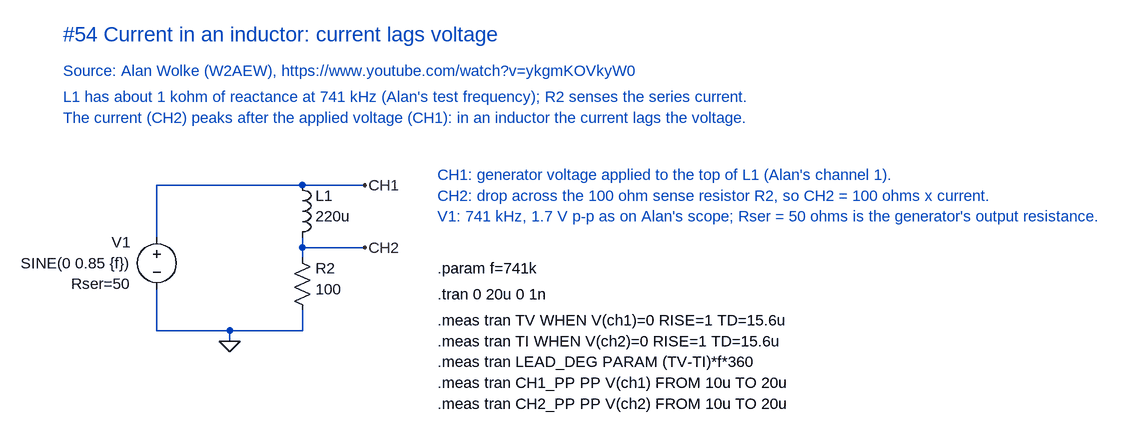
[diagram p0: schematic Current in an Inductor.asc]
Current in an Inductor.asc, the LTspice schematic file:
Version 4.1
SHEET 1 1400 700
WIRE 48 32 272 32
WIRE 272 32 368 32
WIRE 48 32 48 112
WIRE 272 112 272 144
WIRE 272 128 368 128
WIRE 272 224 272 256
WIRE 48 192 48 256
WIRE 48 256 160 256
WIRE 160 256 272 256
WIRE 160 256 160 272
FLAG 160 272 0
FLAG 368 32 CH1
FLAG 368 128 CH2
SYMBOL voltage 48 96 R0
WINDOW 0 -40 24 Right 2
WINDOW 3 -40 56 Right 2
WINDOW 123 0 0 Left 0
WINDOW 39 -40 88 Right 2
SYMATTR InstName V1
SYMATTR Value SINE(0 0.85 {f})
SYMATTR SpiceLine Rser=50
SYMBOL ind 256 16 R0
WINDOW 0 36 32 Left 2
WINDOW 3 36 64 Left 2
SYMATTR InstName L1
SYMATTR Value 220u
SYMBOL res 256 128 R0
WINDOW 0 36 32 Left 2
WINDOW 3 36 64 Left 2
SYMATTR InstName R2
SYMATTR Value 100
TEXT -96 -200 Left 3 ;#54 Current in an inductor: current lags voltage
TEXT -96 -144 Left 2 ;Source: Alan Wolke (W2AEW), https://www.youtube.com/watch?v=ykgmKOVkyW0
TEXT -96 -104 Left 2 ;L1 has about 1 kohm of reactance at 741 kHz (Alan's test frequency); R2 senses the series current.
TEXT -96 -72 Left 2 ;The current (CH2) peaks after the applied voltage (CH1): in an inductor the current lags the voltage.
TEXT 480 16 Left 2 ;CH1: generator voltage applied to the top of L1 (Alan's channel 1).
TEXT 480 48 Left 2 ;CH2: drop across the 100 ohm sense resistor R2, so CH2 = 100 ohms x current.
TEXT 480 80 Left 2 ;V1: 741 kHz, 1.7 V p-p as on Alan's scope; Rser = 50 ohms is the generator's output resistance.
TEXT 480 160 Left 2 !.param f=741k
TEXT 480 200 Left 2 !.tran 0 20u 0 1n
TEXT 480 240 Left 2 !.meas tran TV WHEN V(ch1)=0 RISE=1 TD=15.6u
TEXT 480 272 Left 2 !.meas tran TI WHEN V(ch2)=0 RISE=1 TD=15.6u
TEXT 480 304 Left 2 !.meas tran LEAD_DEG PARAM (TV-TI)*f*360
TEXT 480 336 Left 2 !.meas tran CH1_PP PP V(ch1) FROM 10u TO 20u
TEXT 480 368 Left 2 !.meas tran CH2_PP PP V(ch2) FROM 10u TO 20u

The netlist it stands for:
* Current in an Inductor.asc
V1 CH1 0 SINE(0 0.85 {f}) Rser=50
L1 CH1 CH2 220u
R2 CH2 0 100
* #54 Current in an inductor: current lags voltage
* Source: Alan Wolke (W2AEW), https://www.youtube.com/watch?v=ykgmKOVkyW0
* L1 has about 1 kohm of reactance at 741 kHz (Alan's test frequency); R2 senses the series current.
* The current (CH2) peaks after the applied voltage (CH1): in an inductor the current lags the voltage.
* CH1: generator voltage applied to the top of L1 (Alan's channel 1).
* CH2: drop across the 100 ohm sense resistor R2, so CH2 = 100 ohms x current.
* V1: 741 kHz, 1.7 V p-p as on Alan's scope; Rser = 50 ohms is the generator's output resistance.
.param f=741k
.tran 0 20u 0 1n
.meas tran TV WHEN V(ch1)=0 RISE=1 TD=15.6u
.meas tran TI WHEN V(ch2)=0 RISE=1 TD=15.6u
.meas tran LEAD_DEG PARAM (TV-TI)*f*360
.meas tran CH1_PP PP V(ch1) FROM 10u TO 20u
.meas tran CH2_PP PP V(ch2) FROM 10u TO 20u
.backanno
.end